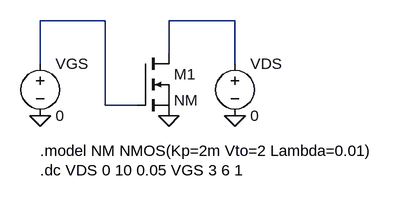
[diagram p0: schematic Ex07.asc]
Ex07.asc, the LTspice schematic file:
Version 4
SHEET 1 880 680
WIRE 100 216 100 150
WIRE 100 150 200 150
WIRE 200 150 200 280
WIRE 200 280 250 280
WIRE 298 200 298 150
WIRE 298 150 400 150
WIRE 400 150 400 216
FLAG 100 296 0
FLAG 298 296 0
FLAG 400 296 0
SYMBOL voltage 100 200 R0
SYMATTR InstName VGS
SYMATTR Value 0
SYMBOL nmos 250 200 R0
SYMATTR InstName M1
SYMATTR Value NM
SYMBOL voltage 400 200 R0
SYMATTR InstName VDS
SYMATTR Value 0
TEXT 100 350 Left 2 !.model NM NMOS(Kp=2m Vto=2 Lambda=0.01)
TEXT 100 380 Left 2 !.dc VDS 0 10 0.05 VGS 3 6 1

The netlist it stands for:
* Ex07.asc
VGS N001 0 0
M1 N002 N001 0 0 NM
VDS N002 0 0
.model NMOS NMOS
.model PMOS PMOS
.lib standard.mos
.model NM NMOS(Kp=2m Vto=2 Lambda=0.01)
.dc VDS 0 10 0.05 VGS 3 6 1
.backanno
.end